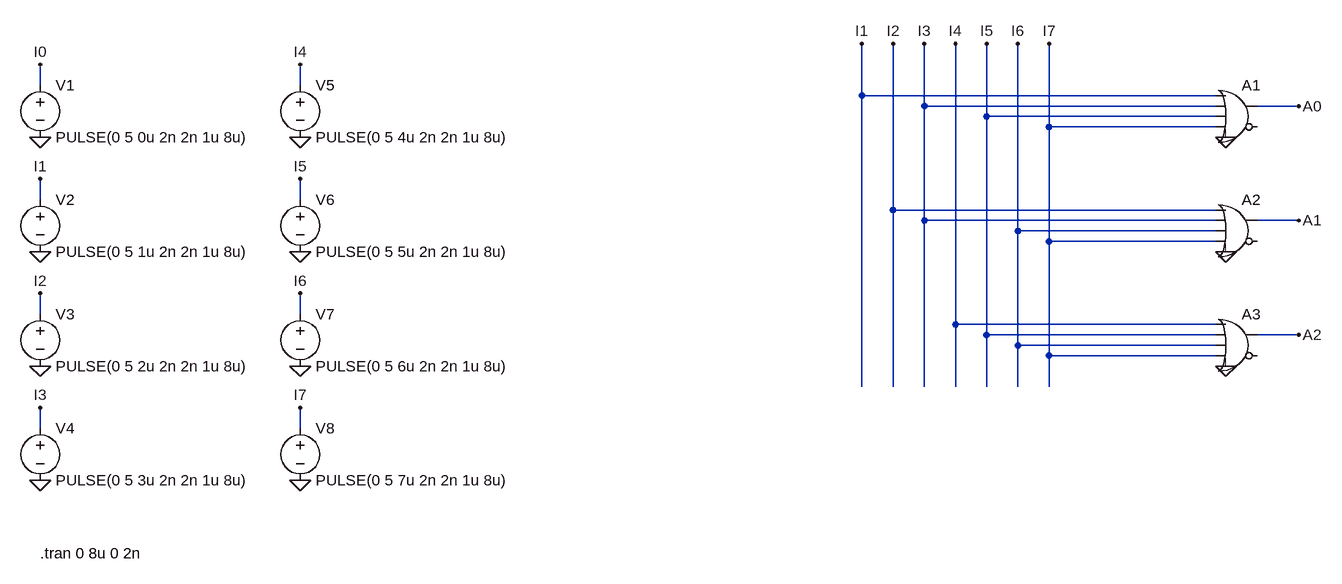
[diagram p0: schematic encoder_8x3.asc]
encoder_8x3.asc, the LTspice schematic file:
Version 4
SHEET 1 2336 992
WIRE -1200 -16 -1200 16
WIRE -1200 160 -1200 192
WIRE -1200 336 -1200 368
WIRE -1200 512 -1200 544
WIRE -800 -16 -800 16
WIRE -800 160 -800 192
WIRE -800 336 -800 368
WIRE -800 512 -800 544
WIRE 64 480 64 -48
WIRE 112 480 112 -48
WIRE 160 480 160 -48
WIRE 208 480 208 -48
WIRE 256 480 256 -48
WIRE 304 480 304 -48
WIRE 352 480 352 -48
WIRE 608 32 64 32
WIRE 608 48 160 48
WIRE 608 64 256 64
WIRE 608 80 352 80
WIRE 624 96 608 96
WIRE 736 48 672 48
WIRE 608 208 112 208
WIRE 608 224 160 224
WIRE 608 240 304 240
WIRE 608 256 352 256
WIRE 624 272 608 272
WIRE 736 224 672 224
WIRE 608 384 208 384
WIRE 608 400 256 400
WIRE 608 416 304 416
WIRE 608 432 352 432
WIRE 624 448 608 448
WIRE 736 400 672 400
FLAG -1200 -16 I0
FLAG -1200 96 0
FLAG -1200 160 I1
FLAG -1200 272 0
FLAG -1200 336 I2
FLAG -1200 448 0
FLAG -1200 512 I3
FLAG -1200 624 0
FLAG -800 -16 I4
FLAG -800 96 0
FLAG -800 160 I5
FLAG -800 272 0
FLAG -800 336 I6
FLAG -800 448 0
FLAG -800 512 I7
FLAG -800 624 0
FLAG 64 -48 I1
FLAG 112 -48 I2
FLAG 160 -48 I3
FLAG 208 -48 I4
FLAG 256 -48 I5
FLAG 304 -48 I6
FLAG 352 -48 I7
FLAG 624 96 0
FLAG 736 48 A0
FLAG 624 272 0
FLAG 736 224 A1
FLAG 624 448 0
FLAG 736 400 A2
SYMBOL voltage -1200 0 R0
SYMATTR InstName V1
SYMATTR Value PULSE(0 5 0u 2n 2n 1u 8u)
SYMBOL voltage -1200 176 R0
SYMATTR InstName V2
SYMATTR Value PULSE(0 5 1u 2n 2n 1u 8u)
SYMBOL voltage -1200 352 R0
SYMATTR InstName V3
SYMATTR Value PULSE(0 5 2u 2n 2n 1u 8u)
SYMBOL voltage -1200 528 R0
SYMATTR InstName V4
SYMATTR Value PULSE(0 5 3u 2n 2n 1u 8u)
SYMBOL voltage -800 0 R0
SYMATTR InstName V5
SYMATTR Value PULSE(0 5 4u 2n 2n 1u 8u)
SYMBOL voltage -800 176 R0
SYMATTR InstName V6
SYMATTR Value PULSE(0 5 5u 2n 2n 1u 8u)
SYMBOL voltage -800 352 R0
SYMATTR InstName V7
SYMATTR Value PULSE(0 5 6u 2n 2n 1u 8u)
SYMBOL voltage -800 528 R0
SYMATTR InstName V8
SYMATTR Value PULSE(0 5 7u 2n 2n 1u 8u)
SYMBOL Digital\\or 640 0 R0
SYMATTR InstName A1
SYMATTR SpiceLine Vhigh=5 Vlow=0 Ref=2.5 Td=10n
SYMBOL Digital\\or 640 176 R0
SYMATTR InstName A2
SYMATTR SpiceLine Vhigh=5 Vlow=0 Ref=2.5 Td=10n
SYMBOL Digital\\or 640 352 R0
SYMATTR InstName A3
SYMATTR SpiceLine Vhigh=5 Vlow=0 Ref=2.5 Td=10n
TEXT -1200 736 Left 2 !.tran 0 8u 0 2n

The netlist it stands for:
* encoder_8x3.asc
V1 I0 0 PULSE(0 5 0u 2n 2n 1u 8u)
V2 I1 0 PULSE(0 5 1u 2n 2n 1u 8u)
V3 I2 0 PULSE(0 5 2u 2n 2n 1u 8u)
V4 I3 0 PULSE(0 5 3u 2n 2n 1u 8u)
V5 I4 0 PULSE(0 5 4u 2n 2n 1u 8u)
V6 I5 0 PULSE(0 5 5u 2n 2n 1u 8u)
V7 I6 0 PULSE(0 5 6u 2n 2n 1u 8u)
V8 I7 0 PULSE(0 5 7u 2n 2n 1u 8u)
A1 I1 I3 I5 I7 0 0 A0 0 OR Vhigh=5 Vlow=0 Ref=2.5 Td=10n
A2 I2 I3 I6 I7 0 0 A1 0 OR Vhigh=5 Vlow=0 Ref=2.5 Td=10n
A3 I4 I5 I6 I7 0 0 A2 0 OR Vhigh=5 Vlow=0 Ref=2.5 Td=10n
.tran 0 8u 0 2n
.backanno
.end